# EAGLE design source_eagle (EAGLE 6.6.0)
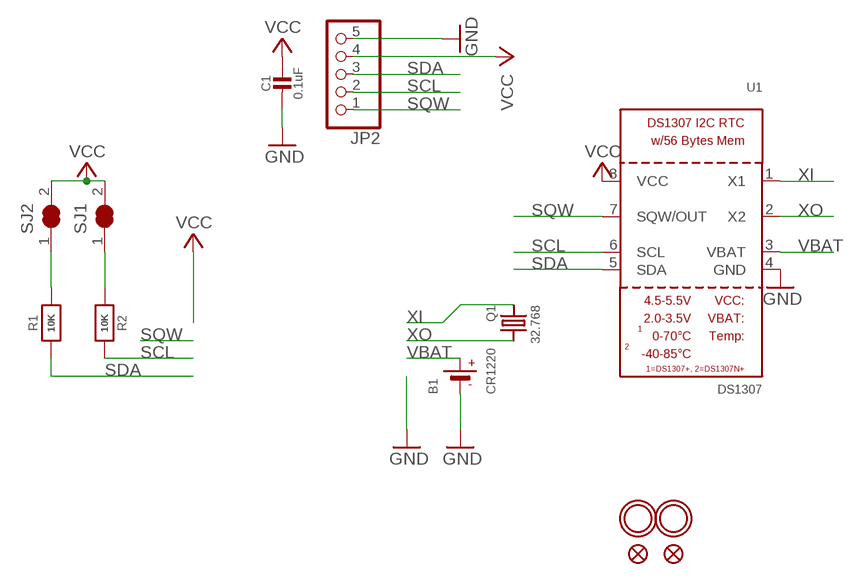
[diagram p0: schematic, sheet 1]

## Parts
B1  CR1220  BATTERYCR1220_SMT  [CR1220]
C1  0.1uF  CAP_CERAMIC0805-NOOUTLINE  [0805-NO]
FID1  FIDUCIAL""  [FIDUCIAL_1MM]
FID2  FIDUCIAL""  [FIDUCIAL_1MM]
JP2  HEADER-1X576MIL  [1X05_ROUND_76]
Q1  32.768  CRYSTAL8.0X3.8  [CRYSTAL_8X3.8]
R1  10K  RESISTOR0805_NOOUTLINE  [0805-NO]
R2  10K  RESISTOR0805_NOOUTLINE  [0805-NO]
SJ1  SOLDERJUMPER_CLOSED  [SOLDERJUMPER_CLOSEDWIRE]
SJ2  SOLDERJUMPER_CLOSED  [SOLDERJUMPER_CLOSEDWIRE]
U1  DS1307  RTC_DS1307  [SOIC8_150MIL]
U$1  MOUNTINGHOLE2.0  [MOUNTINGHOLE_2.0_PLATED]
U$4  MOUNTINGHOLE2.0  [MOUNTINGHOLE_2.0_PLATED]

## Nets
GND: B1.- C1.2 JP2.5 U1.4(GND)
N$1: R2.1 SJ1.1
N$2: R1.2 SJ2.1
SCL: JP2.2 R2.2 U1.6(SCL)
SDA: JP2.3 R1.1 U1.5(SDA)
SQW: JP2.1 U1.7(SQW/OUT)
VBAT: B1.+$1(+) U1.3(VBAT)
VCC: C1.1 JP2.4 SJ1.2 SJ2.2 U1.8(VCC)
XI: Q1.P$1 U1.1(X1)
XO: Q1.P$4 U1.2(X2)

## Library data of the parts
B1 = microbuilder:BATTERY: CR1220 SMT - Digikey: 3001K-ND CD2032 BAT-HLD-001 - Digikey: BAT-HLD-001-ND
C1 = microbuilder:CAP_CERAMIC: Ceramic Capacitors For new designs, use the packages preceded by an '_' character since they are more reliable: The following footprints should be used on most boards: _0402 - Standard footprint for regular board layouts _0603 - Standard footprint for regular board layouts _0805 - Standard footprint for regular board layouts _1206 - Standard footprint for regular board layouts For extremely tight-pitch boards where space is at a premium, the following 'micro-pitch' footprints can be used (smaller pads, no silkscreen outline, etc.): _0402MP - Micro-pitch footprint for very dense/compact boards _0603MP - Micro-pitch footprint for very dense/compact boards _0805MP - Micro-pitch footprint for very dense/compact boards _1206MP - Micro-pitch footprint for very dense/compact boards
FID1 FID2 = microbuilder:FIDUCIAL: Fiducial Alignment Points Various fiducial points for machine vision alignment.; BOM: EXCLUDE
JP2 = microbuilder:HEADER-1X5: PIN HEADER
Q1 = microbuilder:CRYSTAL: Crystals HC49UP - Surface Mount Crystal 4.0MHz 18pF +/-30ppm Surface Mount Crystal [Digikey: 535-9857-1-ND] 12.0 MHz Surface Mount Crystal [Digikey: 535-9869-6-ND] 25.0 MHz Surface Mount Crystal [Digikey: 535-9078-1-ND] 2.5 x 2.0mm - MEMs SMT Crystal 16.0 MHz 10pF 20ppm 2.5 x 2.0mm Crystal [Digikey -40-85°C: 535-10923-1-ND] 3.2 x 2.5mm - MEMs SMT Crystal 12.0 MHz 8pF 15ppm 3.2 x 2.5mm Crystal [Digikey: -10-70°C: 644-1047-1-ND -40-125°C: 644-1128-1-ND] 40~85°C cheaper: 644-1173-6-ND 16.0 MHz 8pF 15ppm 3.2 x 2.5mm Crystal [Digikey: -10-70°C: 644-1049-1-ND -40-125°C: 644-1129-2-ND]-40~85°C cheaper: 644-1175-6-ND 16.0 MHz 10pF 10ppm 3.2 x 2.5mm Crystal [Digikey: 644-1100-1-ND] 27.12 MHz 18pF 30ppm 3.2 x 2.5mm Crystal [Digikey: 887-1424-1-ND] 27.12MHz 10pF 10ppm 3.2 x 2.5mm Crystal [Digikey: 887-1329-1-ND] 4.9 x 1.8mm - MEMs SMT Crystal 32.768 KHz 12.5pF 20ppm 4.9 x 1.8mm Crystal [Digikey: SE2415CT-ND] 8.0 x 3.8mm - Surface Mount Crystal 32.768kHz 12.5pF 20ppm -40°C-85°C [Digikey: 535-9166-2-ND] Cylinder 32.768KHz Cylinder Crystal (2x6mm body) [Ex. Digikey: 300-8341-2-ND]
R1 R2 = microbuilder:RESISTOR: Resistors For new designs, use the packages preceded by an '_' character since they are more reliable: The following footprints should be used on most boards: _0402 - Standard footprint for regular board layouts _0603 - Standard footprint for regular board layouts _0805 - Standard footprint for regular board layouts _1206 - Standard footprint for regular board layouts For extremely tight-pitch boards where space is at a premium, the following 'micro-pitch' footprints can be used (smaller pads, no silkscreen outline, etc.): _0402MP - Micro-pitch footprint for very dense/compact boards _0603MP - Micro-pitch footprint for very dense/compact boards _0805MP - Micro-pitch footprint for very dense/compact boards _1206MP - Micro-pitch footprint for very dense/compact boards
SJ1 SJ2 = microbuilder:SOLDERJUMPER_CLOSED: Solder Jumper - Closed These solder jumpers are closed by default CLOSEDWIRE - 10 mil trace between pads that can be cut and resoldered later CLOSEDPERM - 63 mil trace between pads for a permanent connection (used to 'bridge' two signals, a shameless hack for Eagle). Can double as a test point as well (no cream layer)
U1 = microbuilder:RTC_DS1307: DS1307 I2C RTC with 56-Bytes RAM
U$1 U$4 = microbuilder:MOUNTINGHOLE: Mounting Hole For #2 screws (0.086"/2.18mm width, 0.094"/2.4mm hole) use 2.5mm; BOM: EXCLUDE

## Board
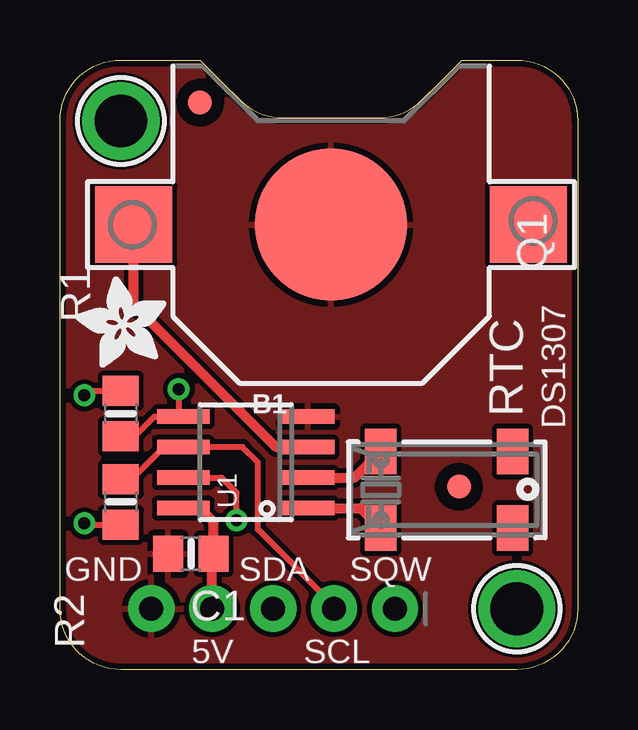
[diagram p1: board, top side]
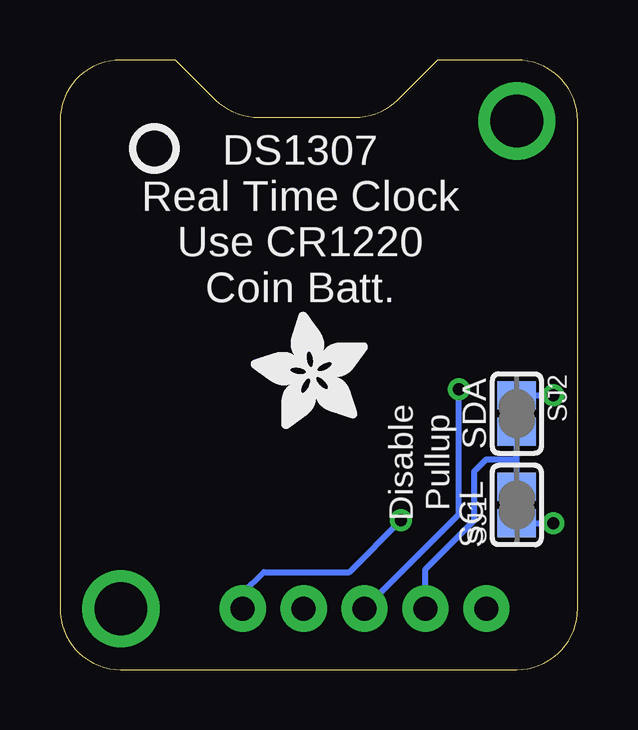
[diagram p2: board, bottom side, seen from below]

Size 21.59 x 25.4 mm. Coordinates in mm from the lower left corner, seen from the top.
Outline: 16.76,25.4 19.05,25.4 arc-90 21.59,22.86 21.59,2.54 arc-90 19.05,0 2.54,0 arc-90 0,2.54 0,22.86 arc-90 2.54,25.4 5.84,25.4 7.51,23.73 arc45 9.31,22.99 13.3,22.99 arc45 15.1,23.73 16.76,25.4
Copper layers (1*16): Top 0.035mm / dielectric 1.5mm / Bottom 0.035mm
Design rules "adafruit *": minimum track width 8mil, minimum drill 15.5mil, track to track 8mil, track to pad 8mil, pad to pad 8mil, via to via 8mil, smd to smd 8mil, copper to edge 10mil, drill to drill 8mil, minimum pad ring 10mil, minimum via ring 8mil, stop-mask expansion 2mil, vias tented up to drill 20mil, thermal gap 10mil

### Footprints (pad centres in the part's own frame; a part is rotated, then mirrored left to right if it is on the bottom)
CR1220 = smd 3.2 x 3.2: +$1 -8.225,0; +$2 8.225,0 | smd 6.35 x 6.35: - 0,0
0805-NO = smd 1.24 x 1.5: 1 -0.95,0; 2 0.95,0
FIDUCIAL_1MM = smd 1 x 1: 1 0,0
1X05_ROUND_76 = drill 1 pad 1.93: 1 -5.08,0; 2 -2.54,0; 3 0,0; 4 2.54,0; 5 5.08,0
CRYSTAL_8X3.8 = smd 1.3 x 1.9: P$1 -2.75,-1.6; P$2 2.75,-1.6; P$3 2.75,1.6; P$4 -2.75,1.6
SOLDERJUMPER_CLOSEDWIRE = smd 1.168 x 1.6: 1 -0.762,0; 2 0.762,0 | smd 0.635 x 0.203: WIRE 0,0
SOIC8_150MIL = smd 0.6 x 2.2: 1 -1.905,-2.6; 2 -0.635,-2.6; 3 0.635,-2.6; 4 1.905,-2.6; 5 1.905,2.6; 6 0.635,2.6; 7 -0.635,2.6; 8 -1.905,2.6
MOUNTINGHOLE_2.0_PLATED = drill 2.2 pad 3: P$1 0,0

### Placement (x,y rotation side)
B1  11.3,18.54 0 top
C1  5.46,4.83 180 top
FID1  5.84,23.62 90 top
FID2  16.64,7.62 90 top
JP2  8.89,2.54 180 top
Q1  16.13,7.49 0 top
R1  2.54,10.67 90 top
R2  2.54,6.99 90 top
SJ1  2.54,6.86 90 bottom
SJ2  2.54,10.67 270 bottom
U1  7.75,8.64 90 top
U$1  2.54,22.86 90 top
U$2  [ADAFRUIT_3.5MM]  4.45,12.57 90 top
U$3  [PCBFEAT-REV-040]  17.65,21.72 180 bottom
U$4  19.05,2.54 90 top
U$5  [ADAFRUIT_5MM]  8.76,10.03 90 bottom

### Tracks (layer width: path | path; a pad name or v marks a point on that pad's centre or on a via)
GND
  pour Top: -0.13,-0.13 21.46,-0.13 21.46,26.29 -0.13,26.29
N$1  (via drill 0.5)
  Top 0.254: v1.02,6.1 1.08,6.04 R2.1
  Bottom 0.254: SJ1.1 v1.02,6.1
N$2  (via drill 0.5)
  Top 0.254: v1.02,11.43 1.2,11.62 R1.2
  Bottom 0.254: SJ2.1 v1.02,11.43
SCL
  Top 0.254: JP2.2 11.43,2.67 8.26,5.84 8.26,8.64 7.62,9.27 U1.6 4.32,9.27 2.98,7.93 R2.2
SDA  (via drill 0.5)
  Top 0.254: v4.95,11.68 4.95,10.73 U1.5 3.94,10.54 3.11,9.72 R1.1
  Bottom 0.254: JP2.3 4.95,6.48 v4.95,11.68
SQW  (via drill 0.5)
  Top 0.254: v7.37,6.22 7.37,7.37 6.73,8 U1.7
  Bottom 0.254: JP2.1 13.97,3.17 13.08,4.06 9.53,4.06 v7.37,6.22
VBAT
  Top 0.406: B1.+$1 3.08,15.21 9.02,9.27 U1.3
VCC
  Top 0.406: U1.8 5.84,6.73 6.41,6.16 C1.1 6.35,4.76 JP2.4
  Bottom 0.254: SJ1.2 2.54,8.76 | 2.54,8.76 SJ2.2 | JP2.4 6.35,4.19 4.32,6.22 4.32,8.26 3.81,8.76 2.54,8.76
XI
  Top 0.406: U1.1 12.54,6.73 Q1.P$1
XO
  Top 0.406: U1.2 12.29,8 Q1.P$4

### Text on the board
tPlace: RTC | DS1307 | GND | SDA | SQW | 5V | SCL
bPlace: DS1307 / Real Time Clock / Use CR1220 / Coin Batt. | SDA | Disable / Pullup | SCL